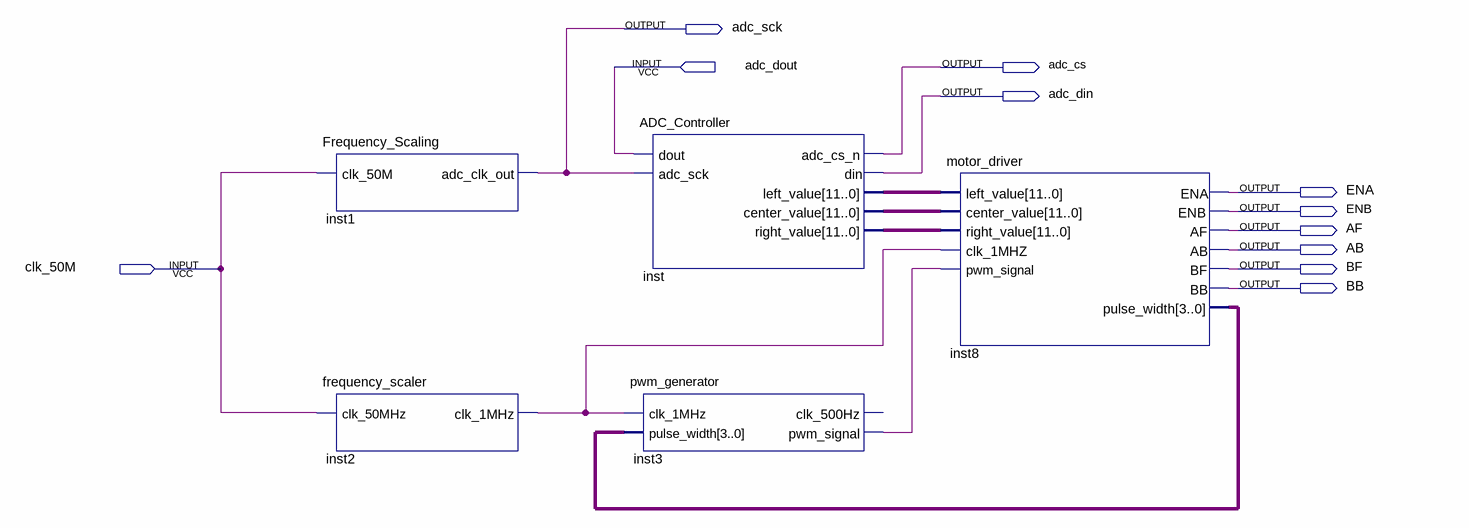
[diagram p0: schematic sheet]
// Quartus schematic LINE_FOLLOWER.bdf as structural Verilog: 5 symbols, 11 pins
module LINE_FOLLOWER (
  input  adc_dout,
  input  clk_50M,
  output adc_sck,
  output adc_cs,
  output adc_din,
  output ENA,
  output ENB,
  output AF,
  output AB,
  output BF,
  output BB
);

  wire inst2_clk_1mhz, inst3_pwm_signal;
  wire [3:0] inst8_pulse_width;
  wire [11:0] inst_center_value, inst_left_value, inst_right_value;

  Frequency_Scaling inst1 (.clk_50M(clk_50M), .adc_clk_out(adc_sck));
  frequency_scaler inst2 (.clk_50MHz(clk_50M), .clk_1MHz(inst2_clk_1mhz));
  ADC_Controller inst (
    .dout(adc_dout), .adc_sck(adc_sck), .adc_cs_n(adc_cs), .din(adc_din), .left_value(inst_left_value),
    .center_value(inst_center_value), .right_value(inst_right_value));
  pwm_generator inst3 (
    .clk_1MHz(inst2_clk_1mhz), .pulse_width(inst8_pulse_width), .pwm_signal(inst3_pwm_signal));  // open: clk_500Hz
  motor_driver inst8 (
    .left_value(inst_left_value), .center_value(inst_center_value), .right_value(inst_right_value),
    .clk_1MHZ(inst2_clk_1mhz), .pwm_signal(inst3_pwm_signal), .ENA(ENA), .ENB(ENB), .AF(AF), .AB(AB),
    .BF(BF), .BB(BB), .pulse_width(inst8_pulse_width));
endmodule
